# Altium schematic sheet Single_RPI2354A.SchDoc
size A; SheetNumber: 2; SheetTotal: 2
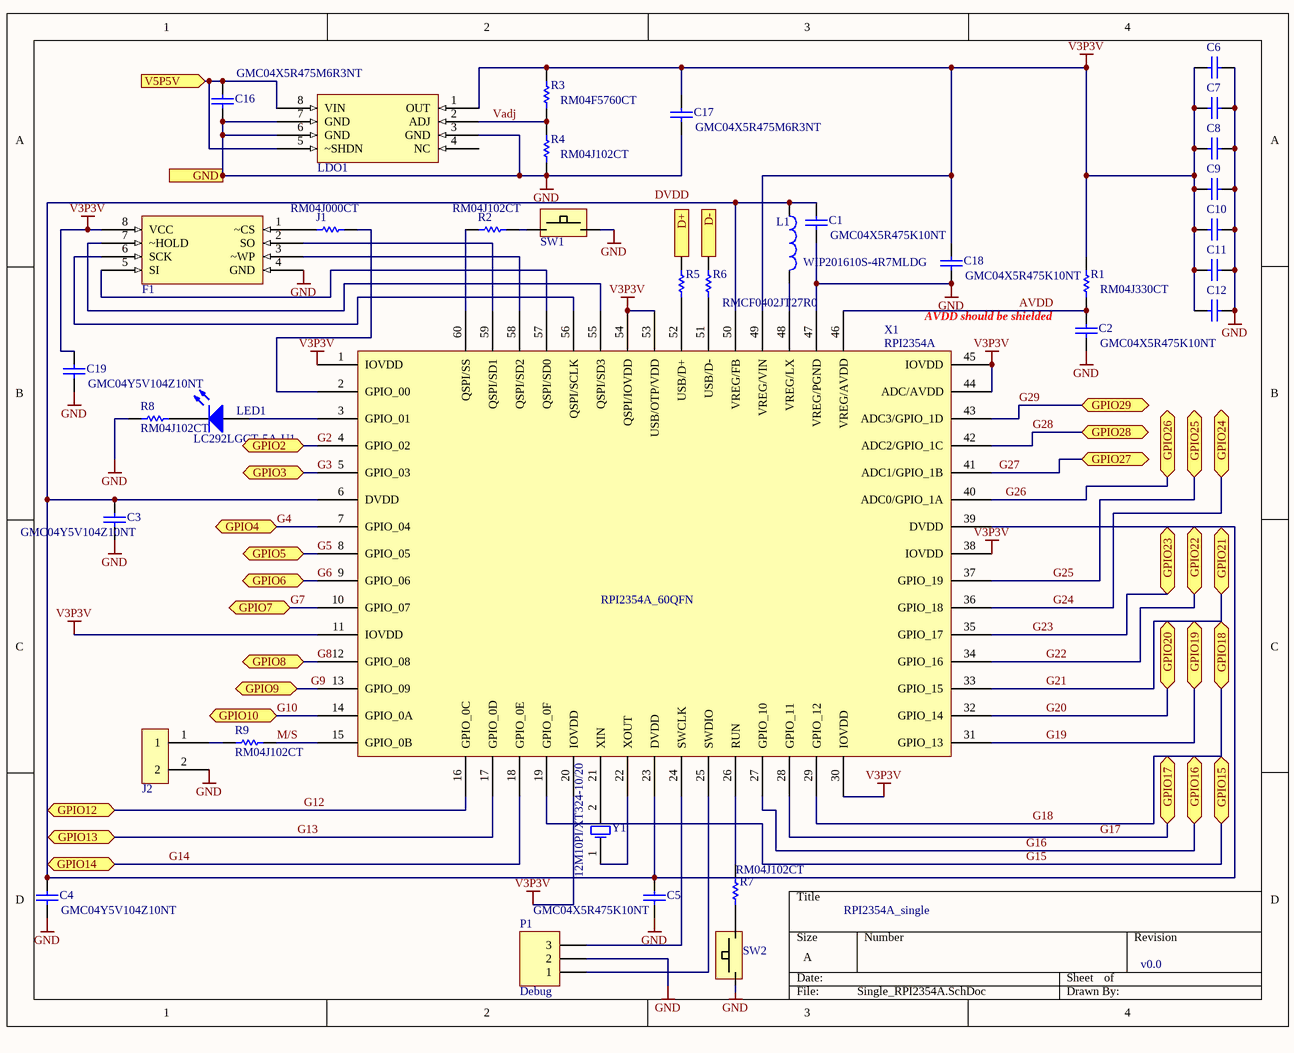
[diagram p0: Single_RPI2354A.SchDoc]

## Parts
C1  GMC04X5R475K10NT  [0402]
C2  GMC04X5R475K10NT  [0402]
C3  GMC04Y5V104Z10NT  [0402]
C4  GMC04Y5V104Z10NT  [0402]
C5  GMC04X5R475K10NT  [0402]
C6  GMC04Y5V104Z10NT  [0402]  (value not drawn)
C7  GMC04Y5V104Z10NT  [0402]  (value not drawn)
C8  GMC04Y5V104Z10NT  [0402]  (value not drawn)
C9  GMC04Y5V104Z10NT  [0402]  (value not drawn)
C10  GMC04Y5V104Z10NT  [0402]  (value not drawn)
C11  GMC04Y5V104Z10NT  [0402]  (value not drawn)
C12  GMC04Y5V104Z10NT  [0402]  (value not drawn)
C16  GMC04X5R475M6R3NT  [0402]
C17  GMC04X5R475M6R3NT  [0402]
C18  GMC04X5R475K10NT  [0402]
C19  GMC04Y5V104Z10NT  [0402]
F1  AT25SF128A-SHB-T  [SOIC127P800X216-8N]  (value not drawn)
J1  RM04J000CT  [0402]
J2  jumper_1x2  [HDR1X2]  (value not drawn)
L1  WIP201610S-4R7MLDG  [2016[0806]]
LDO1  ADPL42010A  [SOIC127P600X175-8N]  (value not drawn)
LED1  LC292LGCT-5A-U1  [0402]
P1  Debug  [HDR1X3]
R1  RM04J330CT  [0402]
R2  RM04J102CT  [0402]
R3  RM04F5760CT  [0402]
R4  RM04J102CT  [0402]
R5  RMCF0402JT27R0  [0402]
R6  RMCF0402JT27R0  [0402]  (value not drawn)
R7  RM04J102CT  [0402]
R8  RM04J102CT  [0402]
R9  RM04J102CT  [0402]
SW1  PushButton  [CT11024.3F260]  (value not drawn)
SW2  PushButton  [CT11024.3F260]  (value not drawn)
X1  RPI2354A  [QFN40P700X700X85_HS-61N]
Y1  12M10PI/XT324-10/20  [DFN320X250X70-4N]

## Ports
D+ (in, see HUB[3A]), D- (out, see HUB[3A]), GND (in, see HUB[3A]), GPIO2 (bidir, see HUB[3A]), GPIO3 (bidir, see HUB[3A]), GPIO4 (bidir, see HUB[3A]), GPIO5 (bidir, see HUB[3A]), GPIO6 (bidir, see HUB[3B]), GPIO7 (bidir, see HUB[3B]), GPIO8 (bidir, see HUB[3B]), GPIO9 (bidir, see HUB[3B]), GPIO10 (bidir, see HUB[3B]), GPIO12 (bidir, see HUB[3B]), GPIO13 (bidir, see HUB[3B]), GPIO14 (bidir, see HUB[3B]), GPIO15 (bidir, see HUB[4A]), GPIO16 (bidir, see HUB[4A]), GPIO17 (bidir, see HUB[4A]), GPIO18 (bidir, see HUB[4A]), GPIO19 (bidir, see HUB[4A]), GPIO20 (bidir, see HUB[4A]), GPIO21 (bidir, see HUB[4A]), GPIO22 (bidir, see HUB[4B]), GPIO23 (bidir, see HUB[4B]), GPIO24 (bidir, see HUB[4B]), GPIO25 (bidir, see HUB[4B]), GPIO26 (bidir, see HUB[4B]), GPIO27 (bidir, see HUB[4B]), GPIO28 (bidir, see HUB[4B]), GPIO29 (bidir, see HUB[4B]), V5P5V (in, see HUB[3A])

## Nets
GND: C1.1 C2.1 C3.1 C4.1 C5.1 C6.1 C7.1 C8.1 C9.1 C10.1 C11.1 C12.1 C16.1 C17.1 C18.1 C19.1 F1.4(GND) J2.2 LDO1.3(GND) LDO1.6(GND) LDO1.7(GND) P1.2 R4.1 R8.1 SW1.1(Gate) SW2.2(Source) X1.47(VREG/PGND) ; port GND
V3P3V: C6.2 C7.2 C8.2 C9.2 C10.2 C11.2 C12.2 C17.2 C18.2 C19.2 F1.8(VCC) LDO1.1(OUT) R1.2 R3.2 X1.1(IOVDD) X1.11(IOVDD) X1.20(IOVDD) X1.30(IOVDD) X1.38(IOVDD) X1.44(ADC/AVDD) X1.45(IOVDD) X1.49(VREG/VIN) X1.53(USB/OTP/VDD) X1.54(QSPI/IOVDD)
AVDD: C2.2 R1.1 X1.46(VREG/AVDD)
D+: R5.1 ; port D+
D-: R6.1 ; port D-
DVDD: C1.2 C3.2 C4.2 C5.2 L1.1 X1.6(DVDD) X1.23(DVDD) X1.39(DVDD) X1.50(VREG/FB)
G2: X1.4(GPIO_02) ; port GPIO2
G3: X1.5(GPIO_03) ; port GPIO3
G4: X1.7(GPIO_04) ; port GPIO4
G5: X1.8(GPIO_05) ; port GPIO5
G6: X1.9(GPIO_06) ; port GPIO6
G7: X1.10(GPIO_07) ; port GPIO7
G8: X1.12(GPIO_08) ; port GPIO8
G9: X1.13(GPIO_09) ; port GPIO9
G10: X1.14(GPIO_0A) ; port GPIO10
G12: X1.16(GPIO_0C) ; port GPIO12
G13: X1.17(GPIO_0D) ; port GPIO13
G14: X1.18(GPIO_0E) ; port GPIO14
G15: X1.19(GPIO_0F) ; port GPIO15
G16: X1.27(GPIO_10) ; port GPIO16
G17: X1.28(GPIO_11) ; port GPIO17
G18: X1.29(GPIO_12) ; port GPIO18
G19: X1.31(GPIO_13) ; port GPIO19
G20: X1.32(GPIO_14) ; port GPIO20
G21: X1.33(GPIO_15) ; port GPIO21
G22: X1.34(GPIO_16) ; port GPIO22
G23: X1.35(GPIO_17) ; port GPIO23
G24: X1.36(GPIO_18) ; port GPIO24
G25: X1.37(GPIO_19) ; port GPIO25
G26: X1.40(ADC0/GPIO_1A) ; port GPIO26
G27: X1.41(ADC1/GPIO_1B) ; port GPIO27
G28: X1.42(ADC2/GPIO_1C) ; port GPIO28
G29: X1.43(ADC3/GPIO_1D) ; port GPIO29
M/S: R9.2 X1.15(GPIO_0B)
V5P5V: C16.2 LDO1.5(~SHDN) LDO1.8(VIN) ; port V5P5V
Vadj: LDO1.2(ADJ) R3.1 R4.2
NetF1_1: F1.1(~CS) J1.2
NetF1_2: F1.2(SO) X1.59(QSPI/SD1)
NetF1_3: F1.3(~WP) X1.58(QSPI/SD2)
NetF1_5: F1.5(SI) X1.57(QSPI/SD0)
NetF1_6: F1.6(SCK) X1.56(QSPI/SCLK)
NetF1_7: F1.7(~HOLD) X1.55(QSPI/SD3)
NetJ1_1: J1.1 X1.2(GPIO_00)
NetJ2_1: J2.1 R9.1
NetL1_2: L1.2 X1.48(VREG/LX)
NetLED1_1: LED1.1(A) X1.3(GPIO_01)
NetLED1_2: LED1.2(K) R8.2
NetP1_1: P1.1 X1.25(SWDIO)
NetP1_3: P1.3 X1.24(SWCLK)
NetR2_1: R2.1 SW1.2(Source)
NetR2_2: R2.2 X1.60(QSPI/SS)
NetR5_2: R5.2 X1.52(USB/D+)
NetR6_2: R6.2 X1.51(USB/D-)
NetR7_1: R7.1 X1.26(RUN)
NetR7_2: R7.2 SW2.1(Gate)
NetX1_21: X1.21(XIN) Y1.2(OSC2)
NetX1_22: X1.22(XOUT) Y1.1(OSC1)

Not connected (* = marked no-connect by the designer): LDO1 4(NC)

## Notes on the sheet
- AVDD should be shielded
- RPI2354A_single
- v0.0
- (in symbol RPI2354A) RPI2354A_60QFN

## Library data of the parts
C1-C12 C16-C19 = Cap: Capacitor; Value: 100pF; Published: 8-Jun-2000; LatestRevisionDate: 17-Jul-2002; LatestRevisionNote: Re-released for DXP Platform.; PackageReference: RAD-0.3; Publisher: Altium Limited; PackageDescription: Radial Cap, Thru-Hole; 2 Leads; 0.3 in Pin Spacing
J1 R1-R9 = Res1: Resistor; Value: 1K; Published: 8-Jun-2000; LatestRevisionDate: 17-Jul-2002; LatestRevisionNote: Re-released for DXP Platform.; PackageReference: AXIAL-0.3; Publisher: Altium Limited; PackageDescription: Axial Device, Thru-Hole; 2 Leads; 0.3 in Pin Spacing
L1 = Inductor: Code_IEC: 1005; Value: 10mH; Published: 8-Jun-2000; LatestRevisionDate: 29-May-2009; LatestRevisionNote: IPC-7351 Footprint Added.; PackageReference: 0402-A; Publisher: Altium Limited; PackageDescription: Chip Inductor; Code_JEITA: 0402
LED1 = LED0: Typical INFRARED GaAs LED; Published: 8-Jun-2000; LatestRevisionDate: 08-Jul-2005; LatestRevisionNote: Mech Layer 1 removed.; PackageReference: LED-0; Publisher: Altium Limited; PackageDescription: LED; 2 Leads
P1 = Header 3: Header, 3-Pin; LatestRevisionDate: 17-Jul-2002; LatestRevisionNote: Re-released for DXP Platform.; Publisher: Altium Limited
SW1 SW2 = PushButton: GPTS203211B
Y1 = XTAL: Crystal Oscillator; Published: 8-Jun-2000; LatestRevisionDate: 17-Jul-2002; LatestRevisionNote: Re-released for DXP Platform.; PackageReference: R38; Publisher: Altium Limited; PackageDescription: Crystal, Thru-Hole; 2 Leads; Body 3.1 x 8.2 mm (Dia.xH)